# Altium schematic sheet top.SchDoc
size A4; SheetNumber: 1; SheetTotal: 5
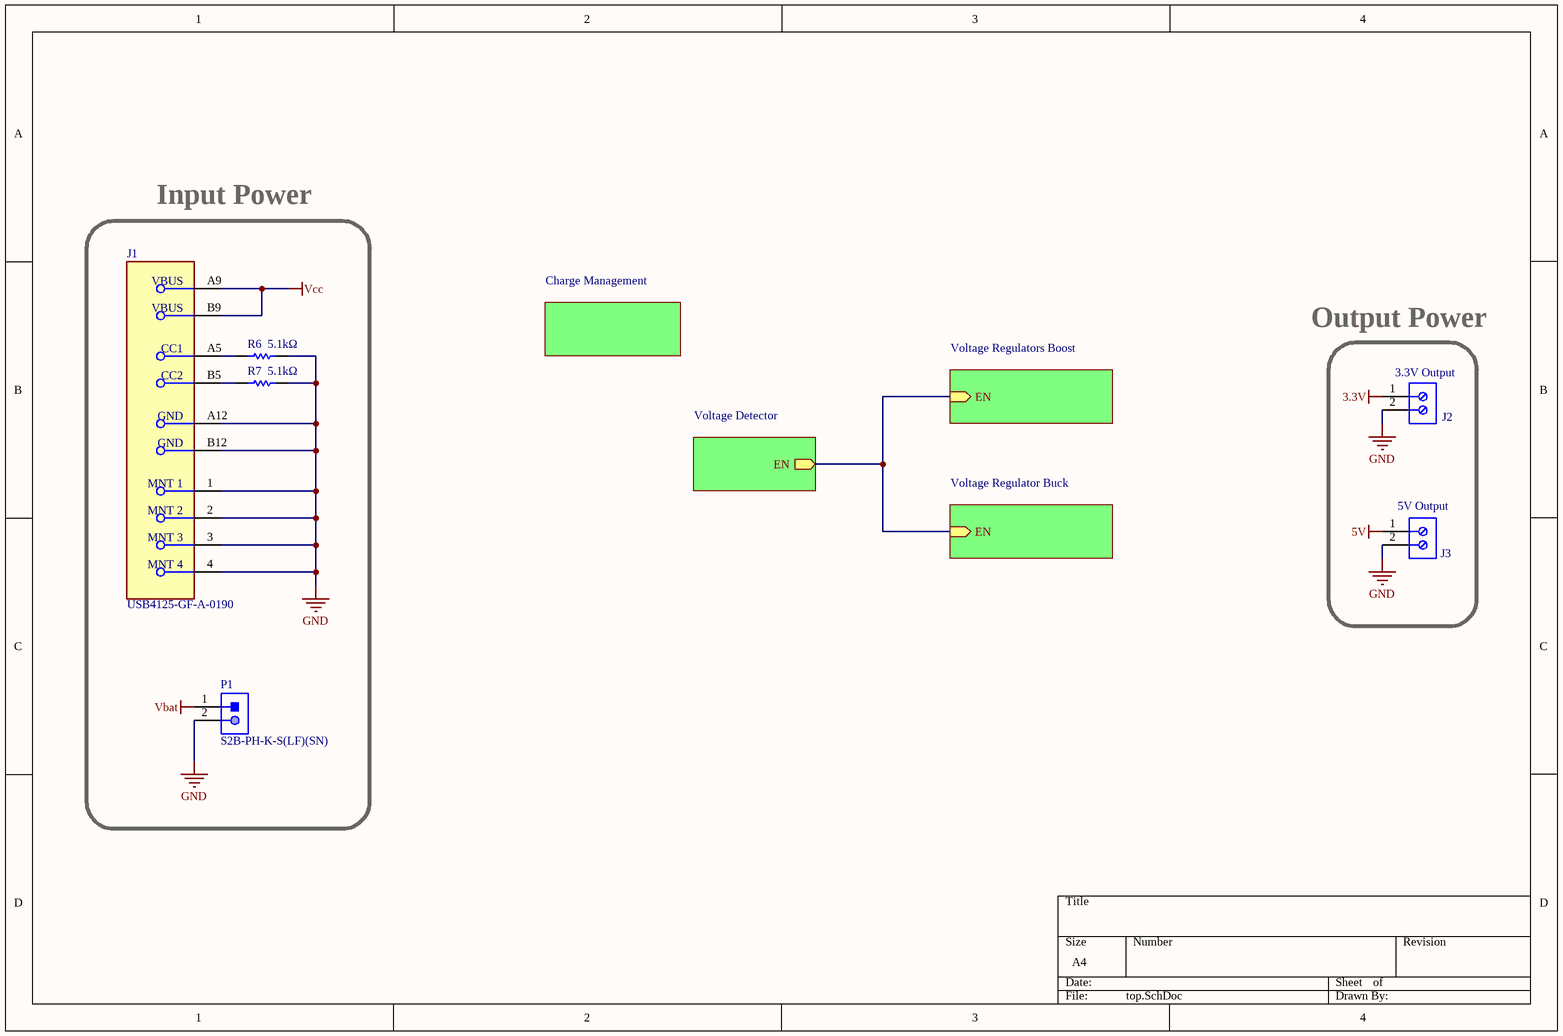
[diagram p0: top.SchDoc]

## Parts
J1  USB4125-GF-A-0190  [FP-USB4125-GF-A-0190-MFG]
J2  3.3V Output  [PHOE-1725656-2]
J3  5V Output  [PHOE-1725656-2]
P1  S2B-PH-K-S(LF)(SN)  [JST-S2B-PH-K-S_V]
R6  5.1kΩ  [RESC1608X55X30LL15T15]
R7  5.1kΩ  [RESC1608X55X30LL15T15]

## Sub-sheets
Charge Management = charge_management.SchDoc: no entries
Voltage Detector = voltage_detector.SchDoc: EN (out)
Voltage Regulator Buck = voltage_regulators_buck.SchDoc: EN (in)
Voltage Regulators Boost = voltage_regulators_boost.SchDoc: EN (in)

## Nets
3.3V: J2.1
5V: J3.1
GND: J1.1(MNT_1) J1.2(MNT_2) J1.3(MNT_3) J1.4(MNT_4) J1.A12(GND) J1.B12(GND) J2.2 J3.2 P1.2 R6.2 R7.2
Vbat: P1.1
Vcc: J1.A9(VBUS) J1.B9(VBUS)
NetJ1_A5: J1.A5(CC1) R6.1
NetJ1_B5: J1.B5(CC2) R7.1
(unnamed): sheet Voltage Regulators Boost/EN, sheet Voltage Regulator Buck/EN, sheet Voltage Detector/EN

## Notes on the sheet
- Input Power
- Output Power

## Library data of the parts
J1 = CMP-245163-000004-1: CONN RCPT TYPE C 6P SMD RA
J2 J3 = CMP-2000-05299-1: Male Header, Pitch 2.54 mm, 1 x 2 Position, Height 9 mm, Tail Length 3.5 mm; Manufacturer part No.: 1725656; Manufacturer: Phoenix Contact; Number of contacts: 2; Content: 250pc(s); Pitch: 2.54mm; Industrial packaging: Yes; Colour: Green; Type: MPT0,5/2-2,54; Datasheet URL: http://datasheet.octopart.com/1725656-Phoenix-Contact-datasheet-5302866.pdf; Manufacturer URL: http://www.phoenixcontact.com/; Datasheet Version: Apr-08
P1 = CMP-1755-00004-1: Male Header, Pitch 2 mm, 1 x 2 Position, Height 4.8 mm, Tail Length 3.4 mm, -25 to 85 degC, RoHS, Bulk; Case\Package: Radial; Tolerance: 20%; Capacitance: 10 uF; Voltage Rating (DC): 50 V; Packaging: Bulk; ComponentLink1URL: http://www.jst-mfg.com/product/pdf/eng/ePH.pdf; Radiation Hardening: No; Height: 11 mm; Package Quantity: 200; PackageDescription: Male Header, Pitch 2 mm, 1 x 2 Position, Height 4.8 mm, Tail Length 3.4 mm; PackageReference: S2B-PH-K-S; Diameter: 5 mm; Pins: 2; Mount: Through Hole; Max Operating Temperature: 85 degC; Min Operating Temperature: -40 degC; ComponentLink1Description: Datasheet; DatasheetVersion: Dec-12; Length: 11 mm; Lead Pitch: 2 mm; REACH SVHC: No SVHC; Voltage Rating: 50 V; RoHSCompliant: true
R6 R7 = CMP-2000-00803-1: Part Number: ERJ-3GEYJ512V; Manufacturer: Panasonic